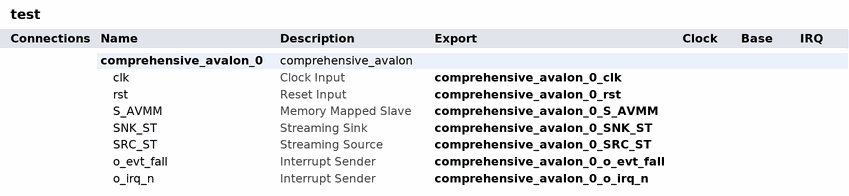
[diagram p0: system contents]
# Platform Designer (Qsys) system test
# Parameters at their usual value, and those the tool derives, are not listed.
package require qsys
create_system test

add_instance comprehensive_avalon_0 comprehensive_avalon 1.0.0

# exported interfaces
add_interface comprehensive_avalon_0_clk clock sink
set_interface_property comprehensive_avalon_0_clk EXPORT_OF comprehensive_avalon_0.clk
add_interface comprehensive_avalon_0_rst reset sink
set_interface_property comprehensive_avalon_0_rst EXPORT_OF comprehensive_avalon_0.rst
add_interface comprehensive_avalon_0_S_AVMM avalon slave
set_interface_property comprehensive_avalon_0_S_AVMM EXPORT_OF comprehensive_avalon_0.S_AVMM
add_interface comprehensive_avalon_0_SRC_ST avalon_streaming source
set_interface_property comprehensive_avalon_0_SRC_ST EXPORT_OF comprehensive_avalon_0.SRC_ST
add_interface comprehensive_avalon_0_SNK_ST avalon_streaming sink
set_interface_property comprehensive_avalon_0_SNK_ST EXPORT_OF comprehensive_avalon_0.SNK_ST
add_interface comprehensive_avalon_0_o_irq_n interrupt sender
set_interface_property comprehensive_avalon_0_o_irq_n EXPORT_OF comprehensive_avalon_0.o_irq_n
add_interface comprehensive_avalon_0_o_evt_fall interrupt sender
set_interface_property comprehensive_avalon_0_o_evt_fall EXPORT_OF comprehensive_avalon_0.o_evt_fall

save_system test.qsys
